# Altium schematic sheet MCU.SchDoc
size A; SheetNumber: 2; SheetTotal: 5
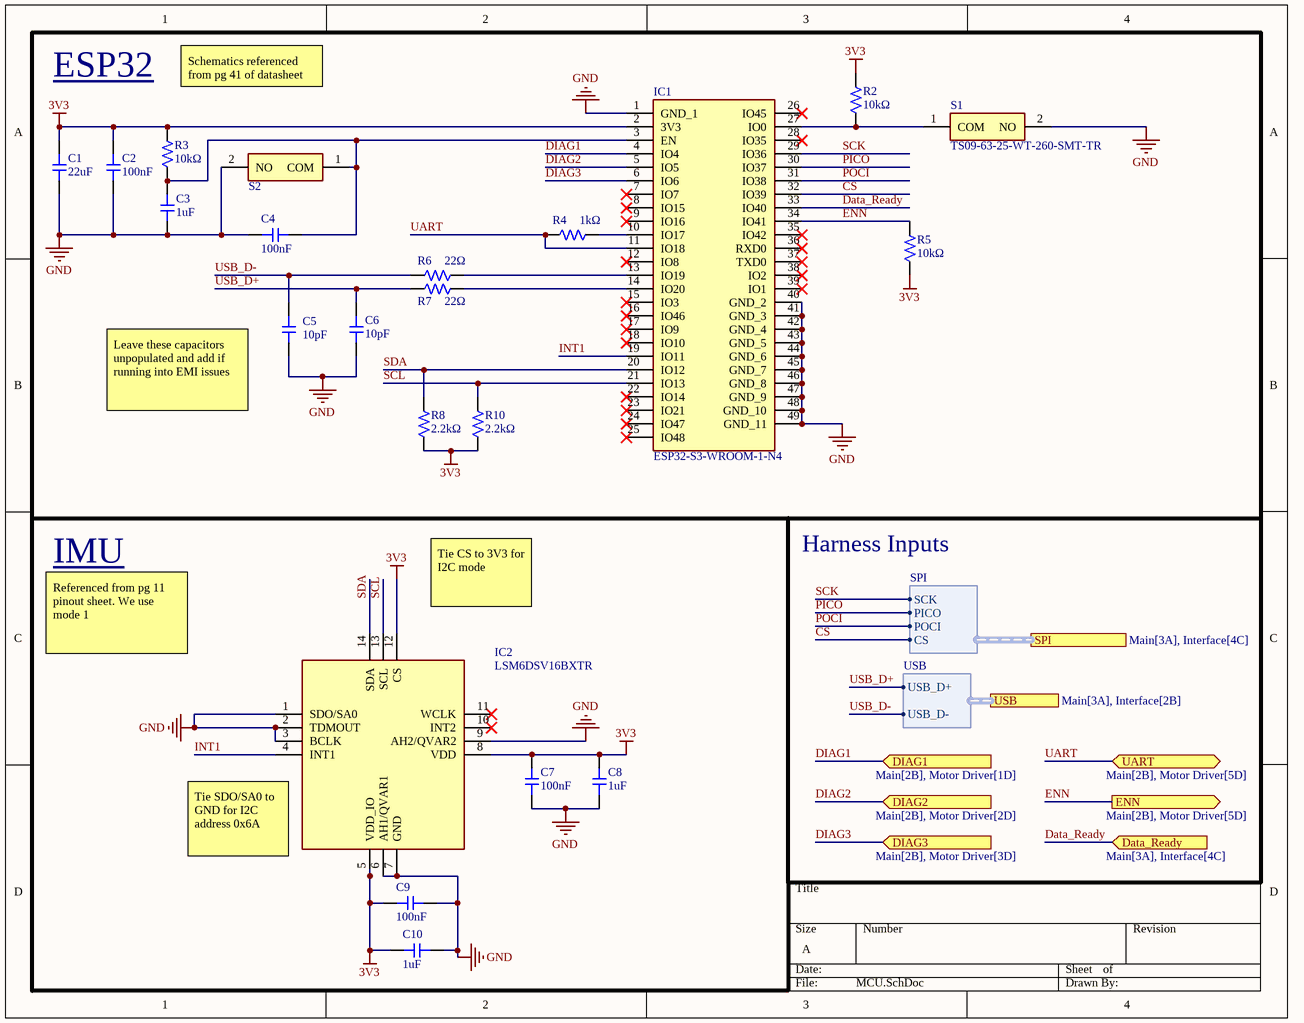
[diagram p0: MCU.SchDoc]

## Parts
C1  Capacitance: 22uF  [CAP-0805]  (hidden comment: CL21A226MAQNNNE)
C2  Capacitance: 100nF  [CAP-0603]  (hidden comment: CC0603KRX7R9BB104)
C3  Capacitance: 1uF  [CAP-0603]  (hidden comment: CL10A105KB8NNNC)
C4  Capacitance: 100nF  [CAP-0603]  (hidden comment: CC0603KRX7R9BB104)
C5  Capacitance: 10pF  [CAP-0603]  (hidden comment: CL10C100JB8NNNC)
C6  Capacitance: 10pF  [CAP-0603]  (hidden comment: CL10C100JB8NNNC)
C7  Capacitance: 100nF  [CAP-0603]  (hidden comment: CC0603KRX7R9BB104)
C8  Capacitance: 1uF  [CAP-0603]  (hidden comment: CL10A105KB8NNNC)
C9  Capacitance: 100nF  [CAP-0603]  (hidden comment: CC0603KRX7R9BB104)
C10  Capacitance: 1uF  [CAP-0603]  (hidden comment: CL10A105KB8NNNC)
IC1  ESP32-S3-WROOM-1-N4  [ESP32S3WROOM1N4]
IC2  LSM6DSV16BXTR  [LSM6DSV16BXTR]
R2  Resistance: 10kΩ  [RES-0603]  (hidden comment: 0603WAF1002T5E)
R3  Resistance: 10kΩ  [RES-0603]  (hidden comment: 0603WAF1002T5E)
R4  Resistance: 1kΩ  [RES-0603]  (hidden comment: 0603WAF1001T5E)
R5  Resistance: 10kΩ  [RES-0603]  (hidden comment: 0603WAF1002T5E)
R6  Resistance: 22Ω  [RES-0603]  (hidden comment: 0603WAF220JT5E)
R7  Resistance: 22Ω  [RES-0603]  (hidden comment: 0603WAF220JT5E)
R8  Resistance: 2.2kΩ  [RES-0603]  (hidden comment: 0603WAF2201T5E)
R10  Resistance: 2.2kΩ  [RES-0603]  (hidden comment: 0603WAF2201T5E)
S1  TS09-63-25-WT-260-SMT-TR  [TS096325WT260SMTTR]
S2  TS09-63-25-WT-260-SMT-TR  [TS096325WT260SMTTR]  (value not drawn)

## Ports
Data_Ready (in, see Main[3A], Interface[4C]), DIAG1 (in, see Main[2B], Motor Driver[1D]), DIAG2 (in, see Main[2B], Motor Driver[2D]), DIAG3 (in, see Main[2B], Motor Driver[3D]), ENN (out, see Main[2B], Motor Driver[5D]), SPI (harness SPI, see Main[3A], Interface[4C]), UART (bidir, see Main[2B], Motor Driver[5D]), USB (harness USB, see Main[3A], Interface[2B])

## Harnesses
SPI: SCK, PICO, POCI, CS
USB: USB_D+, USB_D-

## Nets
3V3: C1.2 C2.2 C7.2 C8.2 C9.1 C10.1 IC1.2(3V3) IC2.5(VDD_IO) IC2.8(VDD) IC2.12(CS) R2.2 R3.2 R5.1 R8.1 R10.1
GND: C1.1 C2.1 C3.1 C4.1 C5.1 C6.1 C7.1 C8.1 C9.2 C10.2 IC1.1(GND_1) IC1.40(GND_2) IC1.41(GND_3) IC1.42(GND_4) IC1.43(GND_5) IC1.44(GND_6) IC1.45(GND_7) IC1.46(GND_8) IC1.47(GND_9) IC1.48(GND_10) IC1.49(GND_11) IC2.1(SDO/SA0) IC2.2(TDMOUT) IC2.3(BCLK) IC2.6(AH1/QVAR1) IC2.7(GND) IC2.9(AH2/QVAR2) S1.2(NO) S2.2(NO)
CS: IC1.32(IO39) ; port SPI.CS
Data_Ready: IC1.33(IO40) ; port Data_Ready
DIAG1: IC1.4(IO4) ; port DIAG1
DIAG2: IC1.5(IO5) ; port DIAG2
DIAG3: IC1.6(IO6) ; port DIAG3
ENN: IC1.34(IO41) R5.2 ; port ENN
INT1: IC1.19(IO11) IC2.4(INT1)
PICO: IC1.30(IO37) ; port SPI.PICO
POCI: IC1.31(IO38) ; port SPI.POCI
SCK: IC1.29(IO36) ; port SPI.SCK
SCL: IC1.21(IO13) IC2.13(SCL) R10.2
SDA: IC1.20(IO12) IC2.14(SDA) R8.2
UART: IC1.11(IO18) R4.1 ; port UART
USB_D+: C6.2 R7.1 ; port USB.USB_D+
USB_D-: C5.2 R6.1 ; port USB.USB_D-
NetC3_2: C3.2 C4.2 IC1.3(EN) R3.1 S2.1(COM)
NetIC1_10: IC1.10(IO17) R4.2
NetIC1_13: IC1.13(IO19) R6.2
NetIC1_14: IC1.14(IO20) R7.2
NetIC1_27: IC1.27(IO0) R2.1 S1.1(COM)

Not connected (* = marked no-connect by the designer): IC1 7(IO7)* 8(IO15)* 9(IO16)* 12(IO8)* 15(IO3)* 16(IO46)* 17(IO9)* 18(IO10)* 22(IO14)* 23(IO21)* 24(IO47)* 25(IO48)* 26(IO45)* 28(IO35)* 35(IO42)* 36(RXD0)* 37(TXD0)* 38(IO2)* 39(IO1)*; IC2 10(INT2)* 11(WCLK)*

## Notes on the sheet
- ESP32 <https://documentation.espressif.com/esp32-s3-wroom-1_wroom-1u_datasheet_en.pdf>
- Schematics referenced from pg 41 of datasheet
- (near C5) Leave these capacitors unpopulated and add if running into EMI issues
- IMU <https://www.st.com/content/ccc/resource/technical/document/datasheet/group3/fe/cf/21/3f/ed/a7/43/1c/DM00803257/files/DM00803257.pdf/jcr:content/translations/en.DM00803257.pdf>
- Harness Inputs
- Tie CS to 3V3 for I2C mode
- Referenced from pg 11 pinout sheet. We use mode 1
- (near IC2) Tie SDO/SA0 to GND for I2C address 0x6A

## Library data of the parts
C1 = CL21A226MAQNNNE: Capacitor, Ceramic (MLCC), 22uF, ±20%, 25V, X5R, ±20%, SMD 0805; Manufacturer: Samsung Electro-Mechanics; Temperature Rating: -55°C ~ 85°C; Capacitance @ 1V DC Bias: 19.999uF; Capacitance @ 1.2V DC Bias: 19.563uF; Capacitance @ 1.35V DC Bias: 19.202uF; Capacitance @ 1.5V DC Bias: 18.822uF; Capacitance @ 1.8V DC Bias: 18.030uF; Capacitance @ 2.5V DC Bias: 16.029uF; Capacitance @ 3.3V DC Bias: 13.689uF; Capacitance @ 3.7V DC Bias: 12.636uF; Capacitance @ 4.2V DC Bias: 11.463uF; Capacitance @ 5V DC Bias: 9.846uF; Capacitance @ 9V DC Bias: 5.133uF; Capacitance @ 12V DC Bias: 3.756uF; Capacitance @ 15V DC Bias: 2.756uF; Capacitance @ 24V DC Bias: 1.578uF; Impedance (0V Bias) @ 100Hz: 93.6Ω; Impedance (0V Bias) @ 500Hz: 19.1Ω; Impedance (0V Bias) @ 1kHz: 9.64Ω; Impedance (0V Bias) @ 5kHz: 1.97Ω; Impedance (0V Bias) @ 10kHz: 0.992Ω; Impedance (0V Bias) @ 50kHz: 0.203Ω; Impedance (0V Bias) @ 100kHz: 0.102Ω; Impedance (0V Bias) @ 500kHz: 0.0188Ω; Impedance (0V Bias) @ 1MHz: 0.00657Ω; Impedance (0V Bias) @ 5MHz: 0.0137Ω; Impedance (0V Bias) @ 10MHz: 0.0227Ω; Impedance (0V Bias) @ 50MHz: 0.0786Ω; Impedance (0V Bias) @ 100MHz: 0.138Ω; Impedance (0V Bias) @ 500MHz: 0.487Ω; Impedance (0V Bias) @ 1GHz: 0.811Ω; Impedance (0V Bias) @ 2GHz: 1.87Ω; Impedance (0V Bias) @ 5GHz: 2.42Ω; Impedance (25V Bias) @ 100Hz: 1.09E+03Ω; Impedance (25V Bias) @ 500Hz: 219Ω; Impedance (25V Bias) @ 1kHz: 110Ω; Impedance (25V Bias) @ 5kHz: 22.1Ω; Impedance (25V Bias) @ 10kHz: 11Ω; Impedance (25V Bias) @ 50kHz: 2.22Ω; Impedance (25V Bias) @ 100kHz: 1.11Ω; Impedance (25V Bias) @ 500kHz: 0.22Ω; Impedance (25V Bias) @ 1MHz: 0.101Ω; Impedance (25V Bias) @ 5MHz: 0.008Ω; Impedance (25V Bias) @ 10MHz: 0.0343Ω; Impedance (25V Bias) @ 50MHz: 0.0782Ω; Impedance (25V Bias) @ 100MHz: 0.136Ω; Impedance (25V Bias) @ 500MHz: 0.528Ω; Impedance (25V Bias) @ 1GHz: 0.864Ω; Impedance (25V Bias) @ 2GHz: 1.78Ω; Impedance (25V Bias) @ 5GHz: 2.43Ω; Package Size: 0805; JLCPCB Basic Part: Yes; JLCPCB Part Number: C45783; Supplier 1: LCSC; Category: Capacitors - MLCC; Supplier Part Number 1: C45783; Manufacturer Part Number: CL21A226MAQNNNE; Tolerance: ±20%; Voltage Rating: 25V; Temperature Coefficient: X5R; RoHS: Yes; ComponentLink1Description: Datasheet; ComponentLink1URL: https://wmsc.lcsc.com/wmsc/upload/file/pdf/v2/lcsc/2304140030_Samsung-Electro-Mechanics-CL21A226MAQNNNE_C45783.pdf; ComponentLink2Description: JLCPCB Part URL; ComponentLink2URL: https://jlcpcb.com/partdetail/C45783; ComponentLink3Description: LCSC Part URL; ComponentLink3URL: https://lcsc.com/product-detail/Multilayer-Ceramic-Capacitors-MLCC---SMD-SMT_Samsung-Electro-Mechanics-Samsung-Electro-Mechanics-CL21A226MAQNNNE_C45783.html; ComponentLink4Description: Samsung Component Library; ComponentLink4URL: https://weblib.samsungsem.com/mlcc/mlcc-ec.do?partNumber=CL21A226MAQNNN
C2 C4 C7 C9 = CC0603KRX7R9BB104: Capacitor, Ceramic (MLCC), 100nF, ±10%, 50V, X7R, ±10%, SMD 0603; Manufacturer: YAGEO; Package Size: 0603; JLCPCB Basic Part: Yes; JLCPCB Part Number: C14663; Supplier 1: LCSC; Category: Capacitors - MLCC; Supplier Part Number 1: C14663; Manufacturer Part Number: CC0603KRX7R9BB104; Tolerance: ±10%; Voltage Rating: 50V; Temperature Coefficient: X7R; RoHS: Yes; ComponentLink1Description: Datasheet; ComponentLink1URL: https://wmsc.lcsc.com/wmsc/upload/file/pdf/v2/lcsc/2211101700_YAGEO-CC0603KRX7R9BB104_C14663.pdf; ComponentLink2Description: JLCPCB Part URL; ComponentLink2URL: https://jlcpcb.com/partdetail/C14663; ComponentLink3Description: LCSC Part URL; ComponentLink3URL: https://lcsc.com/product-detail/Multilayer-Ceramic-Capacitors-MLCC---SMD-SMT_YAGEO-YAGEO-CC0603KRX7R9BB104_C14663.html
C3 C8 C10 = CL10A105KB8NNNC: Capacitor, Ceramic (MLCC), 1uF, ±10%, 50V, X5R, ±10%, SMD 0603; Manufacturer: Samsung Electro-Mechanics; Temperature Rating: -55°C ~ 85°C; Capacitance @ 1V DC Bias: 1.054uF; Capacitance @ 1.2V DC Bias: 1.044uF; Capacitance @ 1.35V DC Bias: 1.035uF; Capacitance @ 1.5V DC Bias: 1.027uF; Capacitance @ 1.8V DC Bias: 1.007uF; Capacitance @ 2.5V DC Bias: 0.947uF; Capacitance @ 3.3V DC Bias: 0.865uF; Capacitance @ 3.7V DC Bias: 0.824uF; Capacitance @ 4.2V DC Bias: 0.773uF; Capacitance @ 5V DC Bias: 0.695uF; Capacitance @ 9V DC Bias: 0.410uF; Capacitance @ 12V DC Bias: 0.308uF; Capacitance @ 15V DC Bias: 0.231uF; Capacitance @ 24V DC Bias: 0.130uF; Capacitance @ 36V DC Bias: 0.080uF; Capacitance @ 48V DC Bias: 0.063uF; Impedance (0V Bias) @ 100Hz: 1.84E+03Ω; Impedance (0V Bias) @ 500Hz: 378Ω; Impedance (0V Bias) @ 1kHz: 191Ω; Impedance (0V Bias) @ 5kHz: 39.1Ω; Impedance (0V Bias) @ 10kHz: 19.8Ω; Impedance (0V Bias) @ 50kHz: 4.04Ω; Impedance (0V Bias) @ 100kHz: 2.04Ω; Impedance (0V Bias) @ 500kHz: 0.416Ω; Impedance (0V Bias) @ 1MHz: 0.208Ω; Impedance (0V Bias) @ 5MHz: 0.0293Ω; Impedance (0V Bias) @ 10MHz: 0.0159Ω; Impedance (0V Bias) @ 50MHz: 0.0822Ω; Impedance (0V Bias) @ 100MHz: 0.14Ω; Impedance (0V Bias) @ 500MHz: 0.54Ω; Impedance (0V Bias) @ 1GHz: 0.988Ω; Impedance (0V Bias) @ 2GHz: 2.38Ω; Impedance (0V Bias) @ 5GHz: 4.94Ω; Package Size: 0603; JLCPCB Basic Part: Yes; JLCPCB Part Number: C15849; Supplier 1: LCSC; Category: Capacitors - MLCC; Supplier Part Number 1: C15849; Manufacturer Part Number: CL10A105KB8NNNC; Tolerance: ±10%; Voltage Rating: 50V; Temperature Coefficient: X5R; RoHS: Yes; ComponentLink1Description: Datasheet; ComponentLink1URL: https://wmsc.lcsc.com/wmsc/upload/file/pdf/v2/lcsc/2304140030_Samsung-Electro-Mechanics-CL10A105KB8NNNC_C15849.pdf; ComponentLink2Description: JLCPCB Part URL; ComponentLink2URL: https://jlcpcb.com/partdetail/C15849; ComponentLink3Description: LCSC Part URL; ComponentLink3URL: https://lcsc.com/product-detail/Multilayer-Ceramic-Capacitors-MLCC---SMD-SMT_Samsung-Electro-Mechanics-Samsung-Electro-Mechanics-CL10A105KB8NNNC_C15849.html; ComponentLink4Description: Samsung Component Library; ComponentLink4URL: https://weblib.samsungsem.com/mlcc/mlcc-ec.do?partNumber=CL10A105KB8NNN
C5 C6 = CL10C100JB8NNNC: Capacitor, Ceramic (MLCC), 10pF, ±5%, 50V, C0G, ±5%, SMD 0603; Manufacturer: Samsung Electro-Mechanics; Temperature Rating: -55°C ~ 125°C; Impedance (0V Bias) @ 100MHz: 159Ω; Impedance (0V Bias) @ 500MHz: 30.3Ω; Impedance (0V Bias) @ 1GHz: 12.8Ω; Impedance (0V Bias) @ 2GHz: 1.36Ω; Impedance (0V Bias) @ 5GHz: 12.1Ω; Package Size: 0603; JLCPCB Basic Part: Yes; JLCPCB Part Number: C1634; Supplier 1: LCSC; Category: Capacitors - MLCC; Supplier Part Number 1: C1634; Manufacturer Part Number: CL10C100JB8NNNC; Tolerance: ±5%; Voltage Rating: 50V; Temperature Coefficient: C0G; RoHS: Yes; ComponentLink1Description: Datasheet; ComponentLink1URL: https://wmsc.lcsc.com/wmsc/upload/file/pdf/v2/lcsc/2304140030_Samsung-Electro-Mechanics-CL10C100JB8NNNC_C1634.pdf; ComponentLink2Description: JLCPCB Part URL; ComponentLink2URL: https://jlcpcb.com/partdetail/C1634; ComponentLink3Description: LCSC Part URL; ComponentLink3URL: https://lcsc.com/product-detail/Multilayer-Ceramic-Capacitors-MLCC---SMD-SMT_Samsung-Electro-Mechanics-Samsung-Electro-Mechanics-CL10C100JB8NNNC_C1634.html; ComponentLink4Description: Samsung Component Library; ComponentLink4URL: https://weblib.samsungsem.com/mlcc/mlcc-ec.do?partNumber=CL10C100JB8NNN
IC1 = ESP32-S3-WROOM-1-N4: Integrated Circuit; Manufacturer_Name: Espressif Systems; Datasheet Link: https://www.espressif.com/sites/default/files/documentation/esp32-s3-wroom-1_wroom-1u_datasheet_en.pdf; Height: 3.25mm; Manufacturer_Part_Number: ESP32-S3-WROOM-1-N4; Mouser Part Number: 356-ESP32-S3WROOM1N4; Mouser Price/Stock: https://www.mouser.co.uk/ProductDetail/Espressif-Systems/ESP32-S3-WROOM-1-N4?qs=Li%252BoUPsLEnsO%2FkiJOUK0FQ%3D%3D
IC2 = LSM6DSV16BXTR: Integrated Circuit; Manufacturer_Name: STMicroelectronics; Datasheet Link: https://www.st.com/resource/en/datasheet/lsm6dsv16bx.pdf; Height: 0.74mm; Manufacturer_Part_Number: LSM6DSV16BXTR; Mouser Part Number: 511-LSM6DSV16BXTR; Mouser Price/Stock: https://www.mouser.co.uk/ProductDetail/STMicroelectronics/LSM6DSV16BXTR?qs=vvQtp7zwQdMXKB4RqH7GHQ%3D%3D; Arrow Part Number: LSM6DSV16BXTR; Arrow Price/Stock: https://www.arrow.com/en/products/lsm6dsv16bxtr/stmicroelectronics?utm_currency=USD&region=nac
R2 R3 R5 = 0603WAF1002T5E: Resistor, 10kΩ, ±1%, 100mW, 75V, ±100ppm/℃, -55℃~+155℃, SMD 0603; Manufacturer: Uniroyal; Supplier 1: LCSC; Manufacturer Part Number: 0603WAF1002T5E; Supplier Part Number 1: C25804; JLCPCB Part Number: C25804; Power Rating: 100mW; Category: Resistors; Package Size: 0603; JLCPCB Basic Part: Yes; Tolerance: ±1%; Voltage Rating: 75V; Temperature Coefficient: ±100ppm/℃; Temperature Rating: -55℃~+155℃; ComponentLink1Description: Datasheet; ComponentLink1URL: https://wmsc.lcsc.com/wmsc/upload/file/pdf/v2/lcsc/2206010045_UNI-ROYAL-Uniroyal-Elec-0603WAF1002T5E_C25804.pdf; ComponentLink2Description: JLCPCB Part URL; ComponentLink2URL: https://jlcpcb.com/partdetail/C25804
R4 = 0603WAF1001T5E: Resistor, 1kΩ, ±1%, 100mW, 75V, ±100ppm/℃, -55℃~+155℃, SMD 0603; Manufacturer: Uniroyal; Supplier 1: LCSC; Manufacturer Part Number: 0603WAF1001T5E; Supplier Part Number 1: C21190; JLCPCB Part Number: C21190; Power Rating: 100mW; Category: Resistors; Package Size: 0603; JLCPCB Basic Part: Yes; Tolerance: ±1%; Voltage Rating: 75V; Temperature Coefficient: ±100ppm/℃; Temperature Rating: -55℃~+155℃; ComponentLink1Description: Datasheet; ComponentLink1URL: https://wmsc.lcsc.com/wmsc/upload/file/pdf/v2/lcsc/2206010130_UNI-ROYAL-Uniroyal-Elec-0603WAF1001T5E_C21190.pdf; ComponentLink2Description: JLCPCB Part URL; ComponentLink2URL: https://jlcpcb.com/partdetail/C21190
R6 R7 = 0603WAF220JT5E: Resistor, 22Ω, ±1%, 100mW, 75V, ±100ppm/℃, -55℃~+155℃, SMD 0603; Manufacturer: Uniroyal; Supplier 1: LCSC; Manufacturer Part Number: 0603WAF220JT5E; Supplier Part Number 1: C23345; JLCPCB Part Number: C23345; Power Rating: 100mW; Category: Resistors; Package Size: 0603; JLCPCB Basic Part: Yes; Tolerance: ±1%; Voltage Rating: 75V; Temperature Coefficient: ±100ppm/℃; Temperature Rating: -55℃~+155℃; ComponentLink1Description: Datasheet; ComponentLink1URL: https://wmsc.lcsc.com/wmsc/upload/file/pdf/v2/lcsc/2206010100_UNI-ROYAL-Uniroyal-Elec-0603WAF220JT5E_C23345.pdf; ComponentLink2Description: JLCPCB Part URL; ComponentLink2URL: https://jlcpcb.com/partdetail/C23345
R8 R10 = 0603WAF2201T5E: Resistor, 2.2kΩ, ±1%, 100mW, 75V, ±100ppm/℃, -55℃~+155℃, SMD 0603; Manufacturer: Uniroyal; Supplier 1: LCSC; Manufacturer Part Number: 0603WAF2201T5E; Supplier Part Number 1: C4190; JLCPCB Part Number: C4190; Power Rating: 100mW; Category: Resistors; Package Size: 0603; JLCPCB Basic Part: Yes; Tolerance: ±1%; Voltage Rating: 75V; Temperature Coefficient: ±100ppm/℃; Temperature Rating: -55℃~+155℃; ComponentLink1Description: Datasheet; ComponentLink1URL: https://wmsc.lcsc.com/wmsc/upload/file/pdf/v2/lcsc/2206010230_UNI-ROYAL-Uniroyal-Elec-0603WAF2201T5E_C4190.pdf; ComponentLink2Description: JLCPCB Part URL; ComponentLink2URL: https://jlcpcb.com/partdetail/C4190
S1 = TS09-63-25-WT-260-SMT-TR: Switch; Manufacturer_Name: Same Sky; Datasheet Link: https://www.sameskydevices.com/product/resource/ts09.pdf; Height: 2.7mm; Manufacturer_Part_Number: TS09-63-25-WT-260-SMT-TR; Mouser Part Number: 179-TS0925WT260SMTTR; Mouser Price/Stock: https://www.mouser.co.uk/ProductDetail/Same-Sky/TS09-63-25-WT-260-SMT-TR?qs=Rp5uXu7WBW9IcFK5UTCCFQ%3D%3D; Arrow Part Number: TS09-63-25-WT-260-SMT-TR; Arrow Price/Stock: https://www.arrow.com/en/products/ts09-63-25-wt-260-smt-tr/cui-devices?utm_currency=USD&region=nac
S2 = TS09-63-25-WT-260-SMT-TR: Manufacturer_Name: Same Sky; Datasheet Link: https://www.sameskydevices.com/product/resource/ts09.pdf; Height: 2.7mm; Manufacturer_Part_Number: TS09-63-25-WT-260-SMT-TR; Mouser Part Number: 179-TS0925WT260SMTTR; Mouser Price/Stock: https://www.mouser.co.uk/ProductDetail/Same-Sky/TS09-63-25-WT-260-SMT-TR?qs=Rp5uXu7WBW9IcFK5UTCCFQ%3D%3D; Arrow Part Number: TS09-63-25-WT-260-SMT-TR; Arrow Price/Stock: https://www.arrow.com/en/products/ts09-63-25-wt-260-smt-tr/cui-devices?utm_currency=USD&region=nac